# Altium schematic sheet Latching Relays.SchDoc
size A; SheetNumber: 4; SheetTotal: 4
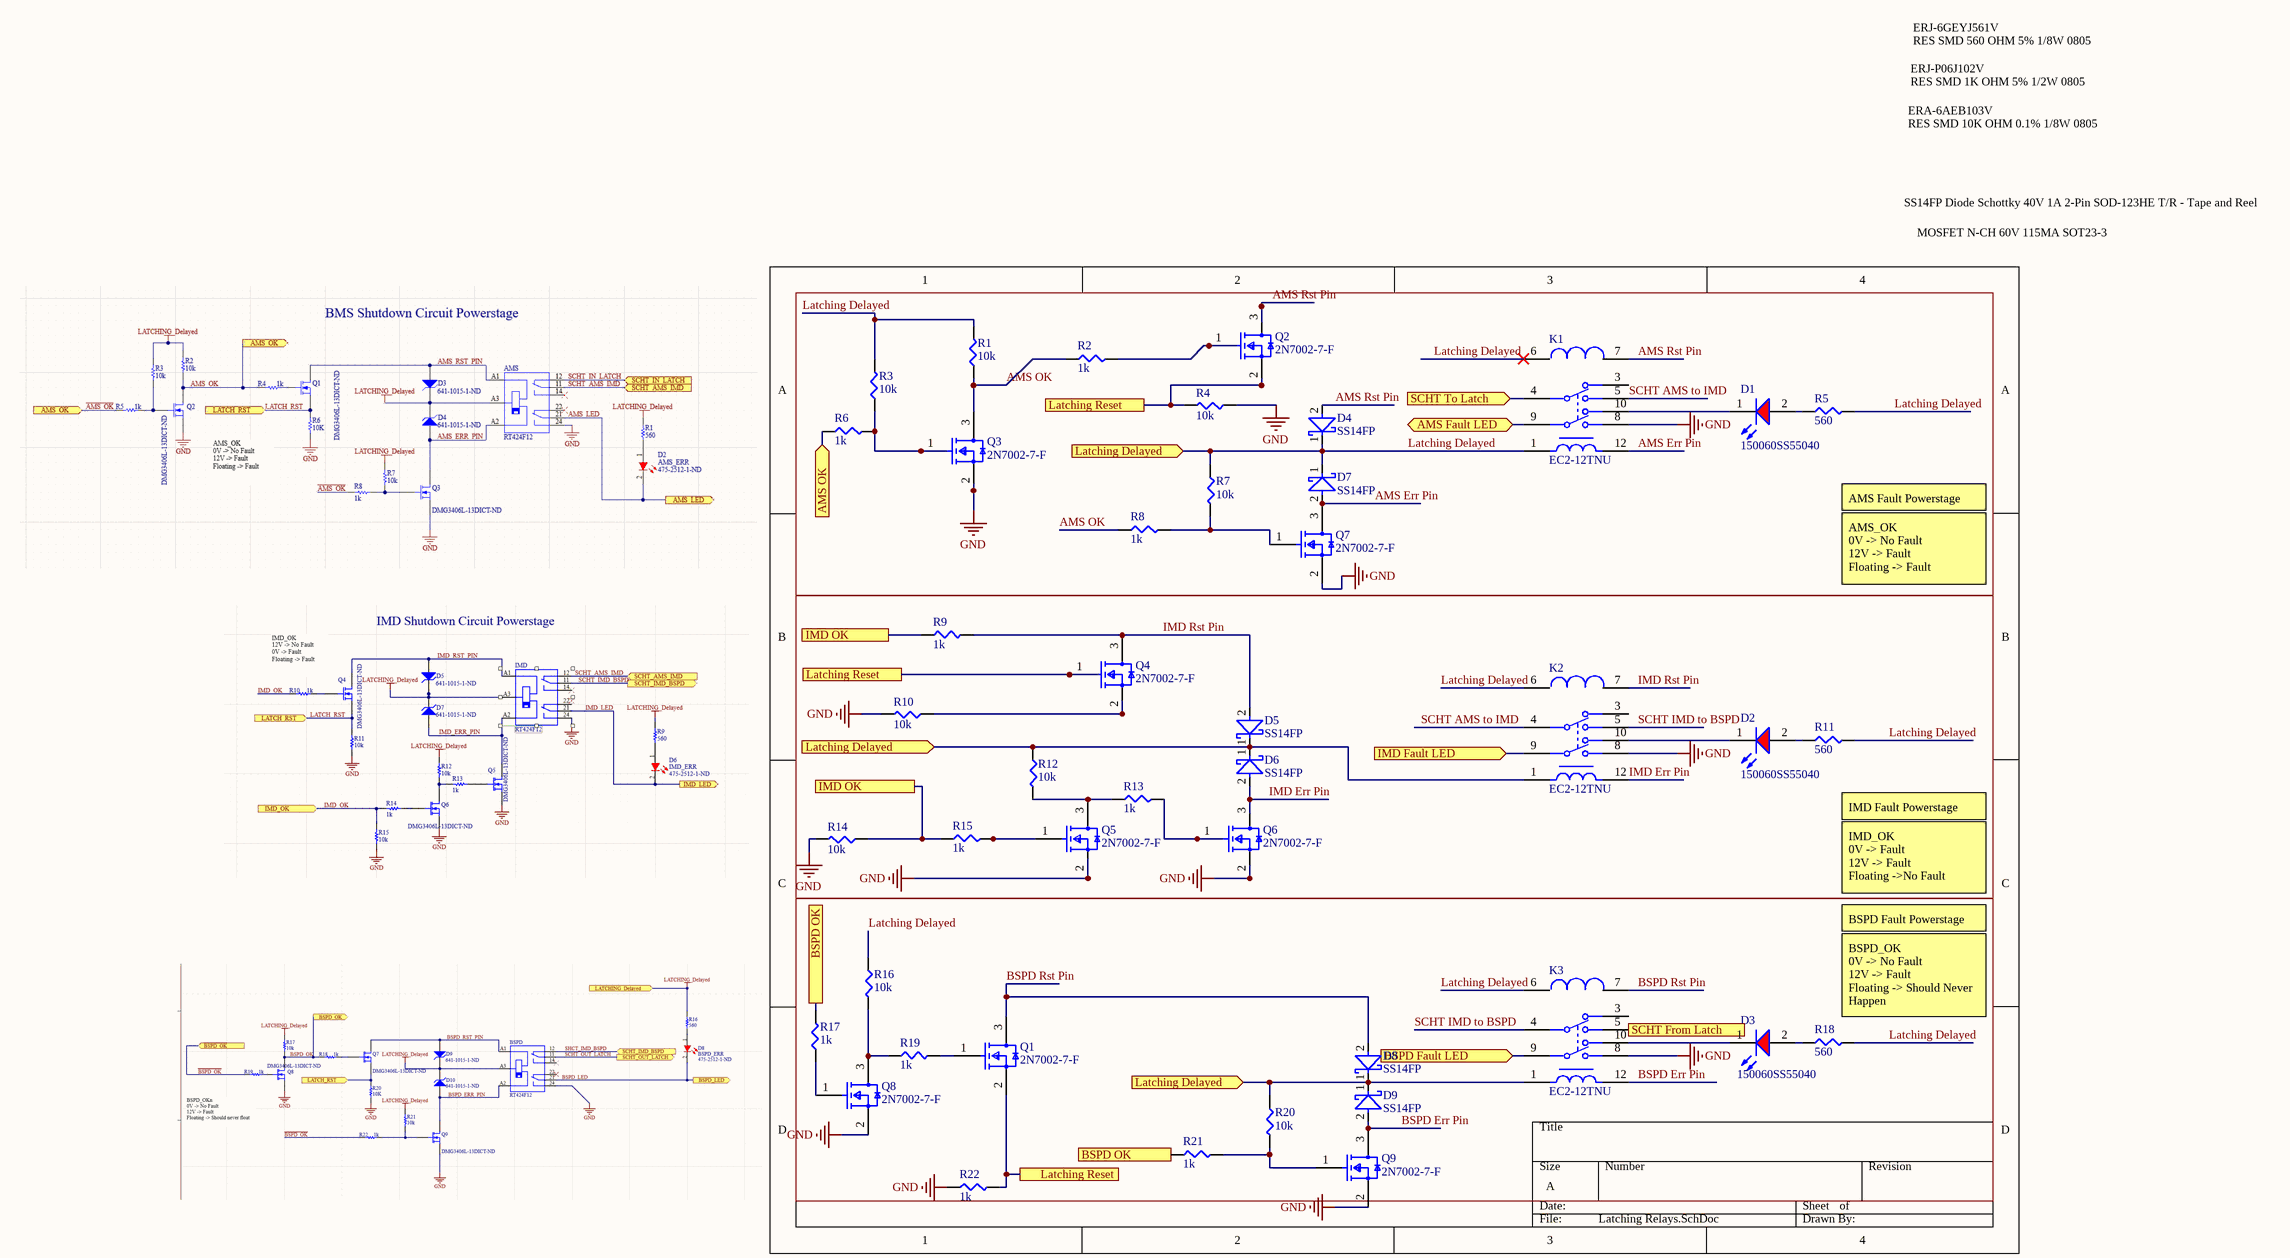
[diagram p0: Latching Relays.SchDoc]

## Parts
D1  150060SS55040  [WL-SMCD_0603]
D2  150060SS55040  [WL-SMCD_0603]
D3  150060SS55040  [WL-SMCD_0603]
D4  SS14FP  [FP-425AC-MFG]
D5  SS14FP  [FP-425AC-MFG]
D6  SS14FP  [FP-425AC-MFG]
D7  SS14FP  [FP-425AC-MFG]
D8  SS14FP  [FP-425AC-MFG]
D9  SS14FP  [FP-425AC-MFG]
K1  EC2-12TNU  [FP-EC2-12TNU-MFG]
K2  EC2-12TNU  [FP-EC2-12TNU-MFG]
K3  EC2-12TNU  [FP-EC2-12TNU-MFG]
Q1  2N7002-7-F  [FP-SOT23-MFG]
Q2  2N7002-7-F  [FP-SOT23-MFG]
Q3  2N7002-7-F  [FP-SOT23-MFG]
Q4  2N7002-7-F  [FP-SOT23-MFG]
Q5  2N7002-7-F  [FP-SOT23-MFG]
Q6  2N7002-7-F  [FP-SOT23-MFG]
Q7  2N7002-7-F  [FP-SOT23-MFG]
Q8  2N7002-7-F  [FP-SOT23-MFG]
Q9  2N7002-7-F  [FP-SOT23-MFG]
R1  10k  [SMD-0805-RES]
R2  1k  [SMD-0805-RES]
R3  10k  [SMD-0805-RES]
R4  10k  [SMD-0805-RES]
R5  560  [SMD-0805-RES]
R6  1k  [SMD-0805-RES]
R7  10k  [SMD-0805-RES]
R8  1k  [SMD-0805-RES]
R9  1k  [SMD-0805-RES]
R10  10k  [SMD-0805-RES]
R11  560  [SMD-0805-RES]
R12  10k  [SMD-0805-RES]
R13  1k  [SMD-0805-RES]
R14  10k  [SMD-0805-RES]
R15  1k  [SMD-0805-RES]
R16  10k  [SMD-0805-RES]
R17  1k  [SMD-0805-RES]
R18  560  [SMD-0805-RES]
R19  1k  [SMD-0805-RES]
R20  10k  [SMD-0805-RES]
R21  1k  [SMD-0805-RES]
R22  1k  [SMD-0805-RES]

## Ports
AMS Fault LED (bidir), AMS OK (in), BSPD Fault LED (in), BSPD OK, IMD Fault LED (in), IMD OK, Latching Delayed (in), Latching Reset, SCHT From Latch, SCHT To Latch (in)

## Nets
GND: K1.8 K2.8 K3.8 Q3.2(S) Q5.2(S) Q6.2(S) Q7.2(S) Q8.2(S) Q9.2(S) R4.1 R10.2 R14.2 R22.1
AMS Err Pin: D7.2(A) K1.12(SET-) Q7.3(D)
AMS Fault LED: K1.9 ; port AMS Fault LED
AMS OK: Q3.3(D) R1.1 R2.1 R8.1
AMS OK: R6.1 ; port AMS OK  [a separate net that carries the same name]
AMS Rst Pin: D4.2(A) K1.7(RESET-) Q2.3(D)
BSPD Err Pin: D9.2(A) K3.12(SET-) Q9.3(D)
BSPD Fault LED: K3.9 ; port BSPD Fault LED
BSPD OK: R17.2 R21.1 ; port BSPD OK
BSPD Rst Pin: D8.2(A) K3.7(RESET-) Q1.3(D)
IMD Err Pin: D6.2(A) K2.12(SET-) Q6.3(D)
IMD Fault LED: K2.9 ; port IMD Fault LED
IMD OK: R9.1 R14.1 R15.1 ; port IMD OK
IMD Rst Pin: D5.2(A) K2.7(RESET-) Q4.3(D) R9.2
Latching Delayed: D4.1(C) D5.1(C) D6.1(C) D7.1(C) D8.1(C) D9.1(C) K1.1(SET+) K1.6(RESET+) K2.1(SET+) K2.6(RESET+) K3.1(SET+) K3.6(RESET+) R1.2 R3.2 R5.2 R7.1 R11.2 R12.1 R16.1 R18.2 R20.1 ; port Latching Delayed
Latching Reset: Q1.2(S) Q2.2(S) Q4.1(G) R4.2 R22.2 ; port Latching Reset
SCHT AMS to IMD: K1.5 K2.4
SCHT From Latch: K3.5 ; port SCHT From Latch
SCHT IMD to BSPD: K2.5 K3.4
SCHT To Latch: K1.4 ; port SCHT To Latch
NetD1_1: D1.1(K) K1.10
NetD1_2: D1.2(A) R5.1
NetD2_1: D2.1(K) K2.10
NetD2_2: D2.2(A) R11.1
NetD3_1: D3.1(K) K3.10
NetD3_2: D3.2(A) R18.1
NetQ1_1: Q1.1(G) R19.2
NetQ2_1: Q2.1(G) R2.2
NetQ3_1: Q3.1(G) R3.1 R6.2
NetQ4_2: Q4.2(S) R10.1
NetQ5_1: Q5.1(G) R15.2
NetQ5_3: Q5.3(D) R12.2 R13.1
NetQ6_1: Q6.1(G) R13.2
NetQ7_1: Q7.1(G) R7.2 R8.2
NetQ8_1: Q8.1(G) R17.1
NetQ8_3: Q8.3(D) R16.2 R19.1
NetQ9_1: Q9.1(G) R20.2 R21.2

Not connected (* = marked no-connect by the designer): K1 3; K2 3; K3 3

## Notes on the sheet
- ERJ-P06J102V
  RES SMD 1K OHM 5% 1/2W 0805
- ERJ-6GEYJ561V
  RES SMD 560 OHM 5% 1/8W 0805
- ERA-6AEB103V
  RES SMD 10K OHM 0.1% 1/8W 0805
- SS14FP Diode Schottky 40V 1A 2-Pin SOD-123HE T/R - Tape and Reel
- MOSFET N-CH 60V 115MA SOT23-3
- AMS Fault Powerstage
- AMS_OK
  0V -> No Fault
  12V -> Fault
  Floating -> Fault
- IMD Fault Powerstage
- IMD_OK
  0V -> Fault
  12V -> Fault
  Floating ->No Fault
- BSPD Fault Powerstage
- (near R18) BSPD_OK
  0V -> No Fault
  12V -> Fault
  Floating -> Should Never Happen

## Library data of the parts
D1-D3 = CMP-03913-90235567-2: 150060SS55040 WL-SMCD SMT Mono-color Chip LED Diffused; Max Reverse Voltage (DC): 5V; Luminous Intensity: 70mcd; Forward Current: 40mA; Wavelength: 630nm; Peak Wavelength: 645nm; Viewing Angle: 140°; Forward Voltage: 2V; Packaging: Tape and Reel; Length: 1.6mm; Height: 400µm; Min Operating Temperature: -40°C; NexarPartId: 90235567; Dominant Wavelength: 630nm; Width: 800µm; Max Operating Temperature: 85°C; RoHS: Compliant
D4-D9 = CMP-00278-84331602-1: SS14FP Diode Schottky 40V 1A 2-Pin SOD-123HE T/R - Tape and Reel; Manufacturer Lifecycle Status: ACTIVE; Max Junction Temperature (Tj): 150°C; Element Configuration: Single; Capacitance: 54pF; Max Forward Surge Current (Ifsm): 30A; Peak Reverse Current: 400µA; Reverse Recovery Time: 6ns; RoHS: Compliant; Min Operating Temperature: -55°C; Max Operating Temperature: 150°C; Lifecycle Status: Production; Forward Current: 1A; Average Rectified Current: 1A; Mount: Surface Mount; Height: 1mm; Max Repetitive Reverse Voltage (Vrrm): 40V; Weight: 18.4mg; NexarPartId: 84331602; Max Reverse Voltage (DC): 40V; Reverse Voltage: 40V; Schedule B: 8541100080, 8541100080
K1-K3 = CMP-03195-000005-1: RELAY GEN PURPOSE DPDT 2A 12VDC; Manufacturer: KEMET; Switching Power: 60W; Coil Type: Latching and Dual Coil; Number Of Contacts: 2; Coil Resistance: 1028Ω; Coil Power: 140mW; Coil Voltage: 12V; Description: Relay; E-Mech; Latching; DPDT; Ctrl-V12DC; 2A; 250VAC; PCB Mnt; Thru Hole; EC2/EE2 Series; Height: 9.4mm; Digikey Description: RELAY GEN PURPOSE DPDT 2A 12VDC; Device Class L2: Relays; Ambient Temperature Range High: +85°C; Current Rating: 2A; ComponentLink2Description: Datasheet; Device Class L1: Electromechanical; Switching Current: 2A; Ambient Temperature Range Low: -40°C; Device Class L3: Signal Relays; Package: 0; Octopart: https://octopart.com/ec2-12tnu-kemet-30529205; Throw Configuration: DPDT; Manufacturer Part Number: EC2-12TNU; Mouser Description: Relay; E-Mech; Latching; DPDT; Ctrl-V12DC; 2A; 250VAC; PCB Mnt; Thru Hole; EC2/EE2 Series; RoHS: TRUE; Automotive: No; Lead Free: Yes; Category: Relay; ComponentLink2URL: https://content.kemet.com/datasheets/KEM_R7002_EC2_EE2.pdf
Q1-Q9 = CMP-2000-04929-2: MOSFET N-CH 60V 115MA SOT23-3; Turn-On Delay Time: 7ns; Turn-Off Delay Time: 11ns; Drain to Source Resistance: 7.5R; Rise Time: 3ns; Drain to Source Breakdown Voltage: 70V; Input Capacitance: 50pF; Number of Elements: 1; Power Dissipation: 540mW; Max Power Dissipation: 300mW; Fall Time: 5.6ns; Gate to Source Voltage (Vgs): 20V; Threshold Voltage: 2.5V; Element Configuration: Single; Termination: SMD/SMT; Weight: 0.000282oz; Radiation Hardening: No; Max Operating Temperature: 150°C; On-State Resistance: 7.5R; Mount: Surface Mount; Current Rating: 115mA; Contact Plating: Tin; Lead Free: Lead Free; Min Operating Temperature: -55°C; Number of Pins: 3; REACH SVHC: No SVHC; Drain to Source Voltage (Vdss): 60V; Width: 1.3mm; Package Quantity: 3000; Length: 2.9mm; Case/Package: SOT-23; Number of Channels: 1; Dual Supply Voltage: 60V; Packaging: Tape and Reel; Height: 1mm; Voltage Rating (DC): 60V; Nominal Vgs: 2.5V; Continuous Drain Current (ID): 115mA; Voltage: 60V; Rds On Max: 7.5R
R1 R3 R4 R7 R10 R12 R14 R16 R20 = ERJ-6ENF1002V: RES SMD 10K OHM 1% 1/8W 0805; Manufacturer: Panasonic Electronic Components; Factory Stock: 0; Unit Price (USD): 0.00729; @ qty: 1500; Minimum Quantity: 1; Power (Watts): 0.125W, 1/8W; Temperature Coefficient: ±100ppm/°C; Part Number: ERJ-6ENF1002V; Datasheets: http://industrial.panasonic.com/www-cgi/jvcr13pz.cgi?E+PZ+3+AOA0002+ERJ6ENF1002V+7+WW; Image: //media.digikey.com/Renders/Panasonic%20Renders/ERJ-0805%20Pkg.jpg; Digi-Key Part Number: P10.0KCCT-ND; Quantity Available: 3985614; Packaging: Cut Tape (CT); Series: ERJ; Part Status: Active; Value: 10k; Tolerance: ±1%; Composition: Thick Film; Features: Automotive AEC-Q200; Operating Temperature: -55°C ~ 155°C; Package / Case: 0805 (2012 Metric); Supplier Device Package: 0805; Size / Dimension: 0.079" L x 0.049" W (2.00mm x 1.25mm); Height - Seated (Max): 0.028" (0.70mm); Number of Terminations: 2; Failure Rate: -
R2 R6 R8 R9 R13 R15 R17 R19 R21 R22 = ERJ-6ENF1001V: RES SMD 1K OHM 1% 1/8W 0805; Manufacturer: Panasonic Electronic Components; Factory Stock: 0; Unit Price (USD): 0.00729; @ qty: 1500; Minimum Quantity: 1; Power (Watts): 0.125W, 1/8W; Temperature Coefficient: ±100ppm/°C; Part Number: ERJ-6ENF1001V; Datasheets: http://industrial.panasonic.com/www-cgi/jvcr13pz.cgi?E+PZ+3+AOA0002+ERJ6ENF1001V+7+WW; Image: //media.digikey.com/Renders/Panasonic%20Renders/ERJ-0805%20Pkg.jpg; Digi-Key Part Number: P1.00KCCT-ND; Quantity Available: 12895103; Packaging: Cut Tape (CT); Series: ERJ; Part Status: Active; Value: 1k; Tolerance: ±1%; Composition: Thick Film; Features: Automotive AEC-Q200; Operating Temperature: -55°C ~ 155°C; Package / Case: 0805 (2012 Metric); Supplier Device Package: 0805; Size / Dimension: 0.079" L x 0.049" W (2.00mm x 1.25mm); Height - Seated (Max): 0.028" (0.70mm); Number of Terminations: 2; Failure Rate: -
R5 R11 R18 = ERJ-6ENF5600V: RES SMD 560 OHM 1% 1/8W 0805; Manufacturer: Panasonic Electronic Components; Factory Stock: 0; Unit Price (USD): 0.00729; @ qty: 1500; Minimum Quantity: 1; Power (Watts): 0.125W, 1/8W; Temperature Coefficient: ±100ppm/°C; Part Number: ERJ-6ENF5600V; Datasheets: http://industrial.panasonic.com/www-cgi/jvcr13pz.cgi?E+PZ+3+AOA0002+ERJ6ENF5600V+7+WW; Image: //media.digikey.com/Renders/Panasonic%20Renders/ERJ-0805%20Pkg.jpg; Digi-Key Part Number: P560CCT-ND; Quantity Available: 103348; Packaging: Cut Tape (CT); Series: ERJ; Part Status: Active; Value: 560; Tolerance: ±1%; Composition: Thick Film; Features: Automotive AEC-Q200; Operating Temperature: -55°C ~ 155°C; Package / Case: 0805 (2012 Metric); Supplier Device Package: 0805; Size / Dimension: 0.079" L x 0.049" W (2.00mm x 1.25mm); Height - Seated (Max): 0.028" (0.70mm); Number of Terminations: 2; Failure Rate: -